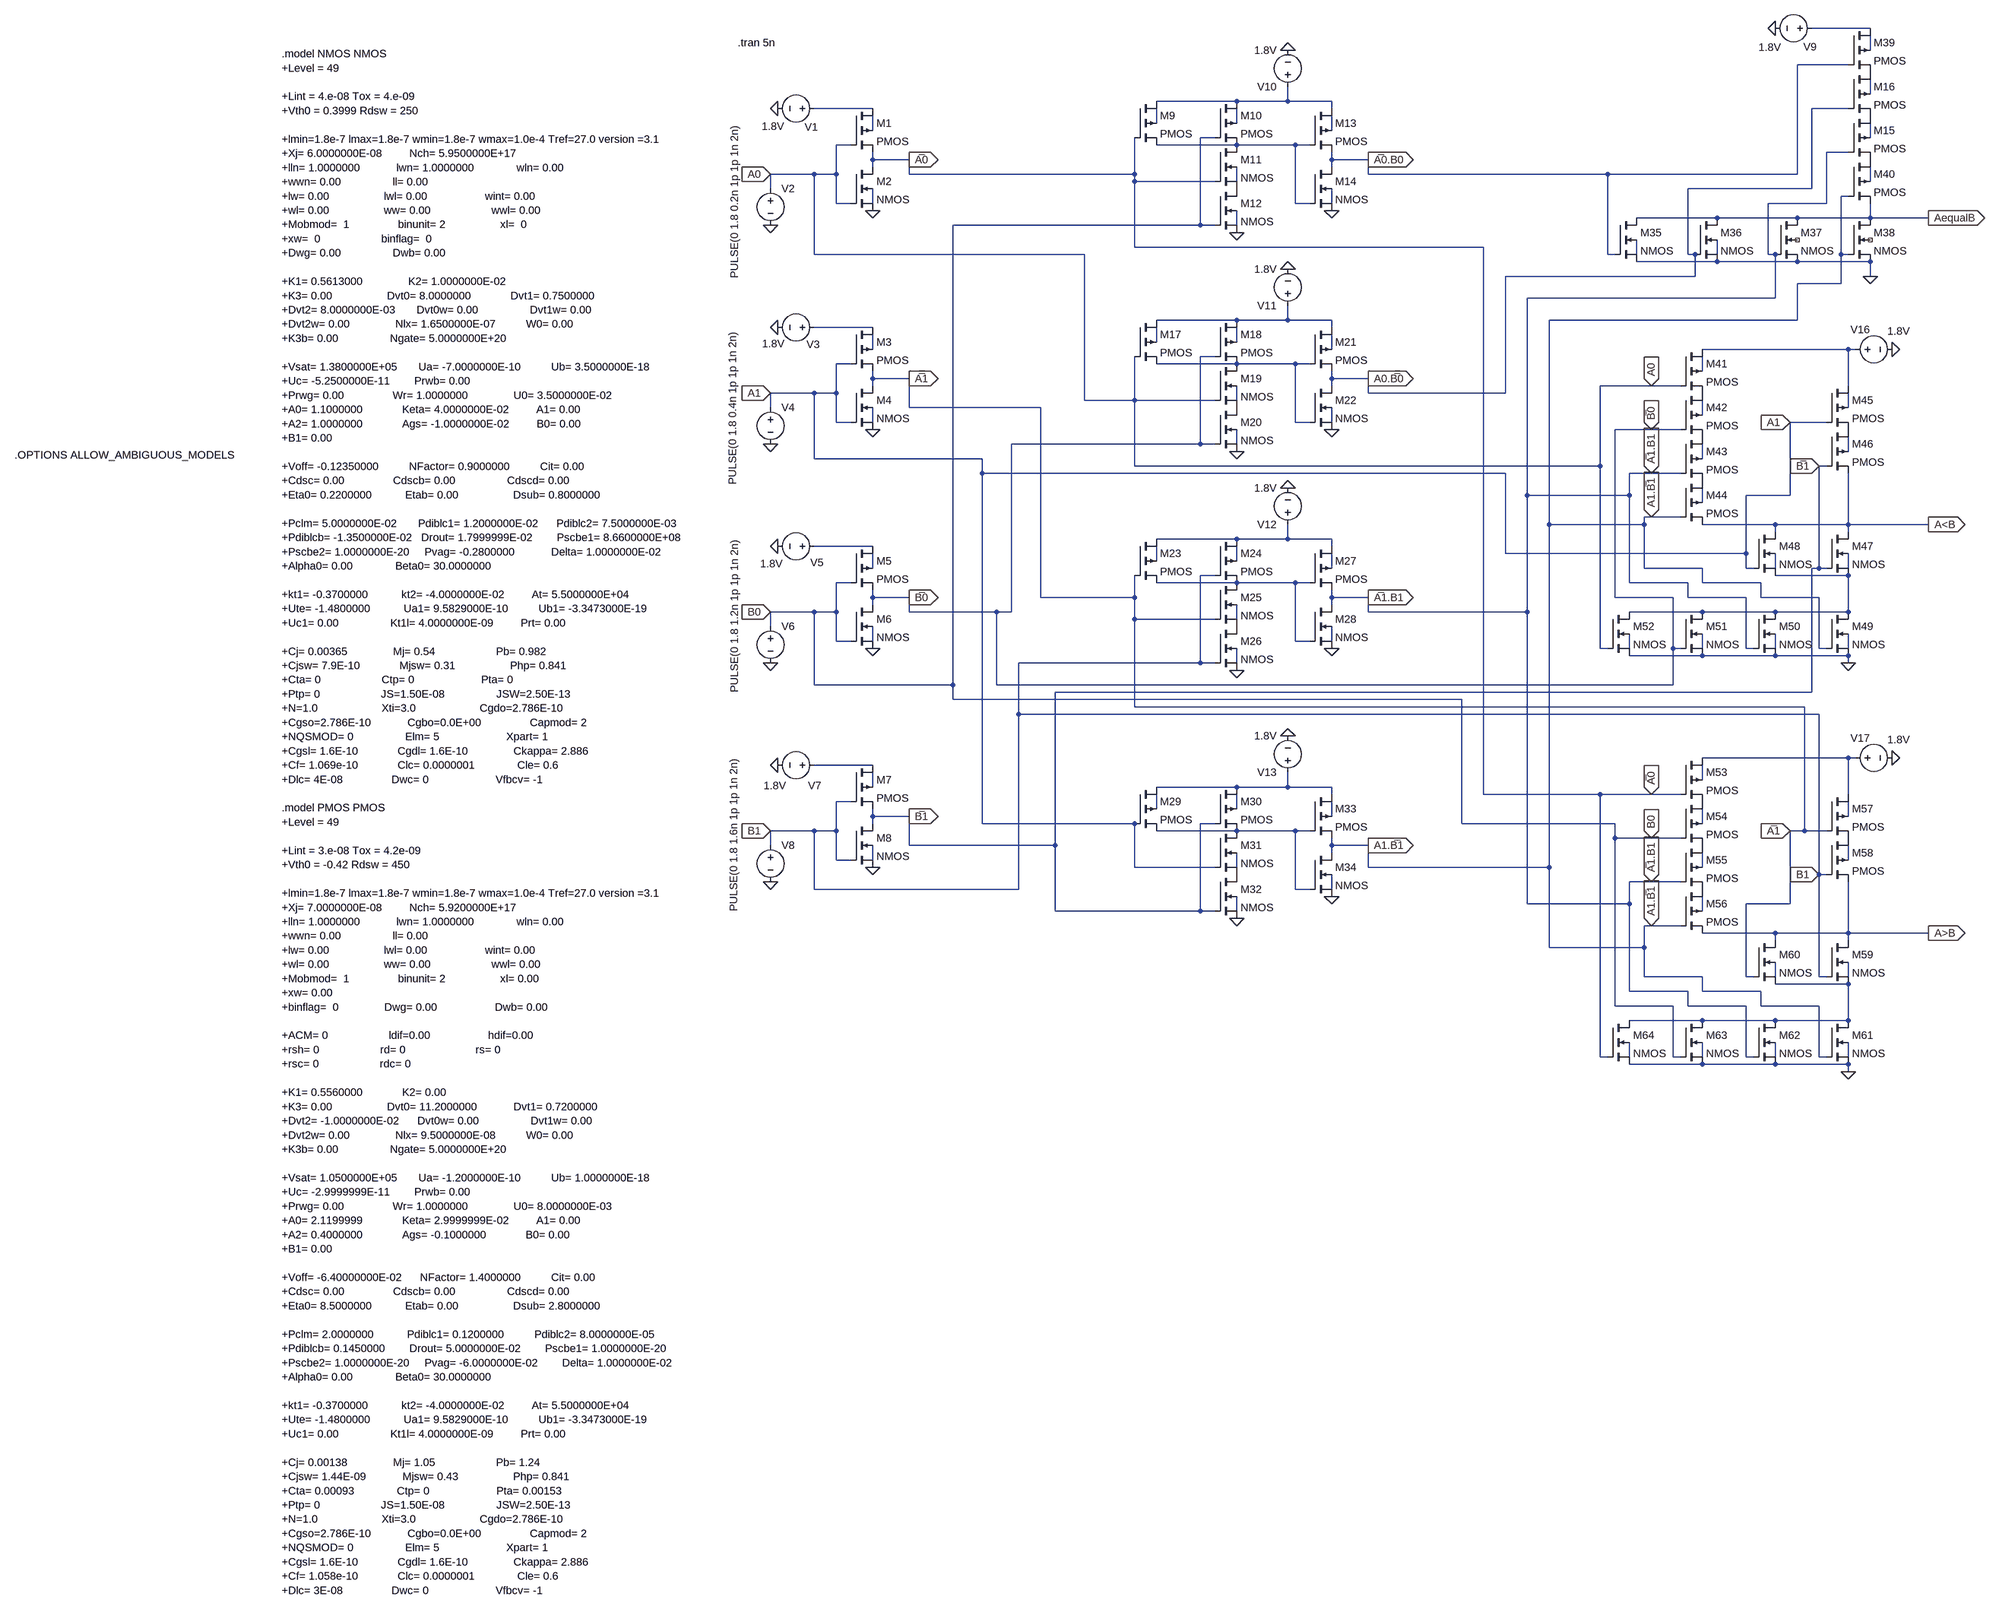
[diagram p0: schematic 2-bit-comparator.asc]
2-bit-comparator.asc, the LTspice schematic file:
Version 4.1
SHEET 1 2748 3000
WIRE 2464 -96 2336 -96
WIRE 2464 -48 2464 -80
WIRE 2416 -16 2304 -16
WIRE 2464 48 2464 16
WIRE 960 64 784 64
WIRE 1072 64 1072 32
WIRE 1072 64 960 64
WIRE 1168 64 1072 64
WIRE 160 80 32 80
WIRE 1168 80 1168 64
WIRE 2416 80 2336 80
WIRE 784 112 784 80
WIRE 960 112 960 80
WIRE 160 128 160 96
WIRE 1168 128 1168 96
WIRE 912 144 880 144
WIRE 2464 144 2464 112
WIRE 112 160 80 160
WIRE 960 160 784 160
WIRE 1088 160 960 160
WIRE 1120 160 1088 160
WIRE 2416 176 2368 176
WIRE 160 192 160 176
WIRE 240 192 160 192
WIRE 1168 192 1168 176
WIRE 1248 192 1168 192
WIRE 160 208 160 192
WIRE 1168 208 1168 192
WIRE 32 224 -64 224
WIRE 80 224 80 160
WIRE 80 224 32 224
WIRE 240 224 240 192
WIRE 736 224 736 144
WIRE 736 224 240 224
WIRE 1248 224 1248 192
WIRE 1888 224 1248 224
WIRE 2304 224 2304 -16
WIRE 2304 224 1888 224
WIRE 736 240 736 224
WIRE 912 240 736 240
WIRE 960 240 960 208
WIRE 2464 240 2464 208
WIRE -64 256 -64 224
WIRE 2336 256 2336 80
WIRE 2336 256 2064 256
WIRE 2416 272 2400 272
WIRE 80 288 80 224
WIRE 112 288 80 288
WIRE 160 288 160 256
WIRE 1088 288 1088 160
WIRE 1120 288 1088 288
WIRE 1168 288 1168 256
WIRE 2368 288 2368 176
WIRE 2368 288 2240 288
WIRE 2128 320 1952 320
WIRE 2304 320 2128 320
WIRE 2464 320 2464 288
WIRE 2464 320 2304 320
WIRE 2592 320 2464 320
WIRE 880 336 880 144
WIRE 880 336 336 336
WIRE 912 336 880 336
WIRE 960 336 960 304
WIRE 736 384 736 240
WIRE 1616 384 736 384
WIRE 32 400 32 224
WIRE 624 400 32 400
WIRE 1888 400 1888 224
WIRE 1904 400 1888 400
WIRE 1952 400 1952 368
WIRE 2064 400 2064 256
WIRE 2080 400 2064 400
WIRE 2128 400 2128 368
WIRE 2240 400 2240 288
WIRE 2256 400 2240 400
WIRE 2400 400 2400 272
WIRE 2416 400 2400 400
WIRE 2128 416 1952 416
WIRE 2304 416 2128 416
WIRE 2464 416 2304 416
WIRE 2080 448 2080 400
WIRE 2080 448 1664 448
WIRE 2464 448 2464 416
WIRE 2400 464 2400 400
WIRE 2400 464 2304 464
WIRE 2256 496 2256 400
WIRE 2256 496 1712 496
WIRE 960 544 784 544
WIRE 1072 544 1072 512
WIRE 1072 544 960 544
WIRE 1168 544 1072 544
WIRE 2304 544 2304 464
WIRE 2304 544 1760 544
WIRE 160 560 32 560
WIRE 1168 560 1168 544
WIRE 784 592 784 560
WIRE 960 592 960 560
WIRE 160 608 160 576
WIRE 1168 608 1168 576
WIRE 2416 608 2096 608
WIRE 2432 608 2416 608
WIRE 912 624 880 624
WIRE 112 640 80 640
WIRE 960 640 784 640
WIRE 1088 640 960 640
WIRE 1120 640 1088 640
WIRE 2096 656 2096 624
WIRE 160 672 160 656
WIRE 240 672 160 672
WIRE 1168 672 1168 656
WIRE 1248 672 1168 672
WIRE 160 688 160 672
WIRE 1168 688 1168 672
WIRE 1984 688 1872 688
WIRE 2048 688 1984 688
WIRE 2416 688 2416 608
WIRE 32 704 -64 704
WIRE 80 704 80 640
WIRE 80 704 32 704
WIRE 1248 704 1248 672
WIRE 1664 704 1664 448
WIRE 1664 704 1248 704
WIRE 624 720 624 400
WIRE 736 720 736 624
WIRE 736 720 624 720
WIRE 912 720 736 720
WIRE 960 720 960 688
WIRE -64 736 -64 704
WIRE 240 736 240 672
WIRE 528 736 240 736
WIRE 2416 736 2416 704
WIRE 2096 752 2096 720
WIRE 80 768 80 704
WIRE 112 768 80 768
WIRE 160 768 160 736
WIRE 1088 768 1088 640
WIRE 1120 768 1088 768
WIRE 1168 768 1168 736
WIRE 2368 768 2288 768
WIRE 1984 784 1904 784
WIRE 2048 784 1984 784
WIRE 880 816 880 624
WIRE 880 816 464 816
WIRE 912 816 880 816
WIRE 960 816 960 784
WIRE 2416 832 2416 800
WIRE 32 848 32 704
WIRE 400 848 32 848
WIRE 2096 848 2096 816
WIRE 736 864 736 720
WIRE 1872 864 1872 688
WIRE 1872 864 736 864
WIRE 2368 864 2352 864
WIRE 400 880 400 848
WIRE 1664 880 400 880
WIRE 1984 880 1936 880
WIRE 2048 880 1984 880
WIRE 1712 928 1712 496
WIRE 1936 928 1936 880
WIRE 1936 928 1712 928
WIRE 2288 928 2288 768
WIRE 2288 928 2192 928
WIRE 2096 944 2096 912
WIRE 1984 976 1968 976
WIRE 2048 976 1984 976
WIRE 1760 992 1760 544
WIRE 1968 992 1968 976
WIRE 1968 992 1760 992
WIRE 2256 992 2096 992
WIRE 2416 992 2416 880
WIRE 2416 992 2256 992
WIRE 2592 992 2416 992
WIRE 2256 1008 2256 992
WIRE 2416 1008 2416 992
WIRE 960 1024 784 1024
WIRE 1072 1024 1072 992
WIRE 1072 1024 960 1024
WIRE 1168 1024 1072 1024
WIRE 160 1040 32 1040
WIRE 1168 1040 1168 1024
WIRE 1664 1056 1664 880
WIRE 2192 1056 2192 928
WIRE 2192 1056 1664 1056
WIRE 784 1072 784 1040
WIRE 960 1072 960 1040
WIRE 160 1088 160 1056
WIRE 1168 1088 1168 1056
WIRE 1968 1088 1968 992
WIRE 2096 1088 1968 1088
WIRE 2192 1088 2192 1056
WIRE 2208 1088 2192 1088
WIRE 2256 1088 2256 1056
WIRE 2352 1088 2352 864
WIRE 2352 1088 2336 1088
WIRE 2368 1088 2352 1088
WIRE 2416 1088 2416 1056
WIRE 912 1104 880 1104
WIRE 2416 1104 2256 1104
WIRE 112 1120 80 1120
WIRE 960 1120 784 1120
WIRE 1088 1120 960 1120
WIRE 1120 1120 1088 1120
WIRE 1936 1120 1936 928
WIRE 2064 1120 1936 1120
WIRE 2096 1120 2096 1088
WIRE 2224 1120 2096 1120
WIRE 160 1152 160 1136
WIRE 240 1152 160 1152
WIRE 528 1152 528 736
WIRE 736 1152 736 1104
WIRE 736 1152 528 1152
WIRE 1168 1152 1168 1136
WIRE 1248 1152 1168 1152
WIRE 1904 1152 1904 784
WIRE 2032 1152 1904 1152
WIRE 2064 1152 2064 1120
WIRE 2192 1152 2064 1152
WIRE 2224 1152 2224 1120
WIRE 2352 1152 2224 1152
WIRE 160 1168 160 1152
WIRE 1168 1168 1168 1152
WIRE 32 1184 -64 1184
WIRE 80 1184 80 1120
WIRE 80 1184 32 1184
WIRE 240 1184 240 1152
WIRE 432 1184 240 1184
WIRE 464 1184 464 816
WIRE 464 1184 432 1184
WIRE 1248 1184 1248 1152
WIRE 1712 1184 1712 928
WIRE 1712 1184 1248 1184
WIRE 2096 1184 1936 1184
WIRE 2256 1184 2096 1184
WIRE 2416 1184 2416 1104
WIRE 2416 1184 2256 1184
WIRE 736 1200 736 1152
WIRE 912 1200 736 1200
WIRE 960 1200 960 1168
WIRE -64 1216 -64 1184
WIRE 80 1248 80 1184
WIRE 112 1248 80 1248
WIRE 160 1248 160 1216
WIRE 1088 1248 1088 1120
WIRE 1120 1248 1088 1248
WIRE 1168 1248 1168 1216
WIRE 1872 1264 1872 864
WIRE 1888 1264 1872 1264
WIRE 1936 1264 1936 1232
WIRE 2032 1264 2032 1152
WIRE 2048 1264 2032 1264
WIRE 2096 1264 2096 1232
WIRE 2192 1264 2192 1152
WIRE 2208 1264 2192 1264
WIRE 2256 1264 2256 1232
WIRE 2352 1264 2352 1152
WIRE 2368 1264 2352 1264
WIRE 2416 1264 2416 1232
WIRE 2096 1280 1936 1280
WIRE 2256 1280 2096 1280
WIRE 2416 1280 2256 1280
WIRE 880 1296 880 1104
WIRE 880 1296 480 1296
WIRE 912 1296 880 1296
WIRE 960 1296 960 1264
WIRE 2416 1296 2416 1280
WIRE 32 1344 32 1184
WIRE 336 1344 336 336
WIRE 336 1344 32 1344
WIRE 432 1344 432 1184
WIRE 2032 1344 2032 1264
WIRE 2032 1344 432 1344
WIRE 2336 1360 2336 1088
WIRE 2336 1360 560 1360
WIRE 336 1376 336 1344
WIRE 1568 1376 336 1376
WIRE 736 1392 736 1200
WIRE 2320 1392 736 1392
WIRE 480 1408 480 1296
WIRE 2352 1408 480 1408
WIRE 2416 1504 2096 1504
WIRE 2432 1504 2416 1504
WIRE 160 1520 32 1520
WIRE 2096 1552 2096 1520
WIRE 160 1568 160 1536
WIRE 960 1568 784 1568
WIRE 1072 1568 1072 1536
WIRE 1072 1568 960 1568
WIRE 1168 1568 1072 1568
WIRE 1168 1584 1168 1568
WIRE 1616 1584 1616 384
WIRE 1872 1584 1616 1584
WIRE 1984 1584 1872 1584
WIRE 2048 1584 1984 1584
WIRE 2416 1584 2416 1504
WIRE 112 1600 80 1600
WIRE 784 1616 784 1584
WIRE 960 1616 960 1584
WIRE 160 1632 160 1616
WIRE 240 1632 160 1632
WIRE 1168 1632 1168 1600
WIRE 2416 1632 2416 1600
WIRE 160 1648 160 1632
WIRE 400 1648 400 880
WIRE 736 1648 400 1648
WIRE 912 1648 880 1648
WIRE 1568 1648 1568 1376
WIRE 1904 1648 1568 1648
WIRE 2096 1648 2096 1616
WIRE 32 1664 -64 1664
WIRE 80 1664 80 1600
WIRE 80 1664 32 1664
WIRE 960 1664 784 1664
WIRE 1088 1664 960 1664
WIRE 1120 1664 1088 1664
WIRE 2320 1664 2320 1392
WIRE 2320 1664 2288 1664
WIRE 2368 1664 2320 1664
WIRE 1904 1680 1904 1648
WIRE 1984 1680 1904 1680
WIRE 2048 1680 1984 1680
WIRE -64 1696 -64 1664
WIRE 240 1696 240 1632
WIRE 560 1696 560 1360
WIRE 560 1696 240 1696
WIRE 1168 1696 1168 1680
WIRE 1248 1696 1168 1696
WIRE 1168 1712 1168 1696
WIRE 80 1728 80 1664
WIRE 112 1728 80 1728
WIRE 160 1728 160 1696
WIRE 2416 1728 2416 1696
WIRE 736 1744 736 1648
WIRE 912 1744 736 1744
WIRE 960 1744 960 1712
WIRE 1248 1744 1248 1696
WIRE 1760 1744 1760 992
WIRE 1760 1744 1248 1744
WIRE 2096 1744 2096 1712
WIRE 2352 1760 2352 1408
WIRE 2368 1760 2352 1760
WIRE 1984 1776 1936 1776
WIRE 2048 1776 1984 1776
WIRE 32 1792 32 1664
WIRE 480 1792 480 1408
WIRE 480 1792 32 1792
WIRE 1088 1792 1088 1664
WIRE 1120 1792 1088 1792
WIRE 1168 1792 1168 1760
WIRE 1712 1824 1712 1184
WIRE 1936 1824 1936 1776
WIRE 1936 1824 1712 1824
WIRE 2288 1824 2288 1664
WIRE 2288 1824 2192 1824
WIRE 560 1840 560 1696
WIRE 880 1840 880 1648
WIRE 880 1840 560 1840
WIRE 912 1840 880 1840
WIRE 960 1840 960 1808
WIRE 2096 1840 2096 1808
WIRE 1984 1872 1968 1872
WIRE 2048 1872 1984 1872
WIRE 2256 1888 2096 1888
WIRE 2416 1888 2416 1776
WIRE 2416 1888 2256 1888
WIRE 2592 1888 2416 1888
WIRE 2256 1904 2256 1888
WIRE 2416 1904 2416 1888
WIRE 1760 1920 1760 1744
WIRE 1968 1920 1968 1872
WIRE 1968 1920 1760 1920
WIRE 1968 1984 1968 1920
WIRE 2096 1984 1968 1984
WIRE 2192 1984 2192 1824
WIRE 2208 1984 2192 1984
WIRE 2256 1984 2256 1952
WIRE 2352 1984 2352 1760
WIRE 2368 1984 2352 1984
WIRE 2416 1984 2416 1952
WIRE 2416 2000 2256 2000
WIRE 1936 2016 1936 1824
WIRE 2064 2016 1936 2016
WIRE 2096 2016 2096 1984
WIRE 2224 2016 2096 2016
WIRE 1904 2048 1904 1680
WIRE 2032 2048 1904 2048
WIRE 2064 2048 2064 2016
WIRE 2192 2048 2064 2048
WIRE 2224 2048 2224 2016
WIRE 2352 2048 2224 2048
WIRE 2096 2080 1936 2080
WIRE 2256 2080 2096 2080
WIRE 2416 2080 2416 2000
WIRE 2416 2080 2256 2080
WIRE 1872 2160 1872 1584
WIRE 1888 2160 1872 2160
WIRE 1936 2160 1936 2128
WIRE 2032 2160 2032 2048
WIRE 2048 2160 2032 2160
WIRE 2096 2160 2096 2128
WIRE 2192 2160 2192 2048
WIRE 2208 2160 2192 2160
WIRE 2256 2160 2256 2128
WIRE 2352 2160 2352 2048
WIRE 2368 2160 2352 2160
WIRE 2416 2160 2416 2128
WIRE 2096 2176 1936 2176
WIRE 2256 2176 2096 2176
WIRE 2416 2176 2256 2176
WIRE 2416 2192 2416 2176
FLAG -48 80 0
FLAG -64 336 0
FLAG -64 224 A0
IOPIN -64 224 In
FLAG 160 304 0
FLAG 240 192 A̅0
IOPIN 240 192 Out
FLAG -48 560 0
FLAG -64 816 0
FLAG -64 704 A1
IOPIN -64 704 In
FLAG 160 784 0
FLAG 240 672 A̅1
IOPIN 240 672 Out
FLAG -48 1040 0
FLAG -64 1296 0
FLAG -64 1184 B0
IOPIN -64 1184 In
FLAG 160 1264 0
FLAG 240 1152 B̅0
IOPIN 240 1152 Out
FLAG -48 1520 0
FLAG -64 1776 0
FLAG -64 1664 B1
IOPIN -64 1664 In
FLAG 160 1744 0
FLAG 240 1632 B̅1
IOPIN 240 1632 Out
FLAG 960 352 0
FLAG 1168 304 0
FLAG 1248 192 A̅0.B0
IOPIN 1248 192 Out
FLAG 1072 -48 0
FLAG 960 832 0
FLAG 1168 784 0
FLAG 1248 672 A0.B̅0
IOPIN 1248 672 Out
FLAG 1072 432 0
FLAG 960 1312 0
FLAG 1168 1264 0
FLAG 1248 1152 A̅1.B1
IOPIN 1248 1152 Out
FLAG 1072 912 0
FLAG 960 1856 0
FLAG 1168 1808 0
FLAG 1248 1696 A1.B̅1
IOPIN 1248 1696 Out
FLAG 2592 320 AequalB
IOPIN 2592 320 Out
FLAG 2416 1296 0
FLAG 2592 992 A<B
IOPIN 2592 992 Out
FLAG 2512 608 0
FLAG 1984 688 A0
IOPIN 1984 688 In
FLAG 1984 784 B̅0
IOPIN 1984 784 In
FLAG 1984 880 A̅1.B1
IOPIN 1984 880 In
FLAG 1984 976 A1.B̅1
IOPIN 1984 976 In
FLAG 2288 768 A1
IOPIN 2288 768 In
FLAG 2352 864 B̅1
IOPIN 2352 864 In
FLAG 1072 1456 0
FLAG 2416 2192 0
FLAG 2592 1888 A>B
IOPIN 2592 1888 Out
FLAG 2512 1504 0
FLAG 1984 1584 A̅0
IOPIN 1984 1584 In
FLAG 1984 1680 B0
IOPIN 1984 1680 In
FLAG 1984 1776 A̅1.B1
IOPIN 1984 1776 In
FLAG 1984 1872 A1.B̅1
IOPIN 1984 1872 In
FLAG 2288 1664 A̅1
IOPIN 2288 1664 In
FLAG 2352 1760 B1
IOPIN 2352 1760 In
FLAG 2256 -96 0
FLAG 2464 448 0
SYMBOL pmos4 112 80 R0
SYMATTR InstName M1
SYMATTR Value2 l=180n w=400n
SYMBOL nmos4 112 208 R0
SYMATTR InstName M2
SYMATTR Value2 l=180n w=400n
SYMBOL voltage 48 80 R90
WINDOW 0 41 8 VRight 2
WINDOW 3 39 82 VRight 2
WINDOW 123 0 0 Left 0
WINDOW 39 0 0 Left 0
SYMATTR InstName V1
SYMATTR Value 1.8V
SYMBOL voltage -64 240 R0
WINDOW 3 -79 -125 VRight 2
WINDOW 123 0 0 Left 0
WINDOW 39 0 0 Left 0
SYMATTR Value PULSE(0 1.8 0.2n 1p 1p 1n 2n)
SYMATTR InstName V2
SYMBOL pmos4 112 560 R0
SYMATTR InstName M3
SYMATTR Value2 l=180n w=400n
SYMBOL nmos4 112 688 R0
SYMATTR InstName M4
SYMATTR Value2 l=180n w=400n
SYMBOL voltage 48 560 R90
WINDOW 0 37 4 VRight 2
WINDOW 3 36 81 VRight 2
WINDOW 123 0 0 Left 0
WINDOW 39 0 0 Left 0
SYMATTR InstName V3
SYMATTR Value 1.8V
SYMBOL voltage -64 720 R0
WINDOW 3 -83 -153 VRight 2
WINDOW 123 0 0 Left 0
WINDOW 39 0 0 Left 0
SYMATTR Value PULSE(0 1.8 0.4n 1p 1p 1n 2n)
SYMATTR InstName V4
SYMBOL pmos4 112 1040 R0
SYMATTR InstName M5
SYMATTR Value2 l=180n w=400n
SYMBOL nmos4 112 1168 R0
SYMATTR InstName M6
SYMATTR Value2 l=180n w=400n
SYMBOL voltage 48 1040 R90
WINDOW 0 36 -5 VRight 2
WINDOW 3 38 85 VRight 2
WINDOW 123 0 0 Left 0
WINDOW 39 0 0 Left 0
SYMATTR InstName V5
SYMATTR Value 1.8V
SYMBOL voltage -64 1200 R0
WINDOW 3 -79 -177 VRight 2
WINDOW 123 0 0 Left 0
WINDOW 39 0 0 Left 0
SYMATTR Value PULSE(0 1.8 1.2n 1p 1p 1n 2n)
SYMATTR InstName V6
SYMBOL pmos4 112 1520 R0
SYMATTR InstName M7
SYMATTR Value2 l=180n w=400n
SYMBOL nmos4 112 1648 R0
SYMATTR InstName M8
SYMATTR Value2 l=180n w=400n
SYMBOL voltage 48 1520 R90
WINDOW 0 45 0 VRight 2
WINDOW 3 45 78 VRight 2
WINDOW 123 0 0 Left 0
WINDOW 39 0 0 Left 0
SYMATTR InstName V7
SYMATTR Value 1.8V
SYMBOL voltage -64 1680 R0
WINDOW 3 -80 -177 VRight 2
WINDOW 123 0 0 Left 0
WINDOW 39 0 0 Left 0
SYMATTR Value PULSE(0 1.8 1.6n 1p 1p 1n 2n)
SYMATTR InstName V8
SYMBOL pmos4 736 64 R0
SYMATTR InstName M9
SYMATTR Value2 l=180n w=400n
SYMBOL pmos4 912 64 R0
SYMATTR InstName M10
SYMATTR Value2 l=180n w=400n
SYMBOL nmos4 912 160 R0
SYMATTR InstName M11
SYMATTR Value2 l=180n w=400n
SYMBOL nmos4 912 256 R0
SYMATTR InstName M12
SYMATTR Value2 l=180n w=400n
SYMBOL pmos4 1120 80 R0
SYMATTR InstName M13
SYMATTR Value2 l=180n w=400n
SYMBOL nmos4 1120 208 R0
SYMATTR InstName M14
SYMATTR Value2 l=180n w=400n
SYMBOL voltage 1072 48 R180
WINDOW 123 0 0 Left 0
WINDOW 39 0 0 Left 0
SYMATTR InstName V10
SYMATTR Value 1.8V
SYMBOL pmos4 736 544 R0
SYMATTR InstName M17
SYMATTR Value2 l=180n w=400n
SYMBOL pmos4 912 544 R0
SYMATTR InstName M18
SYMATTR Value2 l=180n w=400n
SYMBOL nmos4 912 640 R0
SYMATTR InstName M19
SYMATTR Value2 l=180n w=400n
SYMBOL nmos4 912 736 R0
SYMATTR InstName M20
SYMATTR Value2 l=180n w=400n
SYMBOL pmos4 1120 560 R0
SYMATTR InstName M21
SYMATTR Value2 l=180n w=400n
SYMBOL nmos4 1120 688 R0
SYMATTR InstName M22
SYMATTR Value2 l=180n w=400n
SYMBOL voltage 1072 528 R180
WINDOW 123 0 0 Left 0
WINDOW 39 0 0 Left 0
SYMATTR InstName V11
SYMATTR Value 1.8V
SYMBOL pmos4 736 1024 R0
SYMATTR InstName M23
SYMATTR Value2 l=180n w=400n
SYMBOL pmos4 912 1024 R0
SYMATTR InstName M24
SYMATTR Value2 l=180n w=400n
SYMBOL nmos4 912 1120 R0
SYMATTR InstName M25
SYMATTR Value2 l=180n w=400n
SYMBOL nmos4 912 1216 R0
SYMATTR InstName M26
SYMATTR Value2 l=180n w=400n
SYMBOL pmos4 1120 1040 R0
SYMATTR InstName M27
SYMATTR Value2 l=180n w=400n
SYMBOL nmos4 1120 1168 R0
SYMATTR InstName M28
SYMATTR Value2 l=180n w=400n
SYMBOL voltage 1072 1008 R180
WINDOW 123 0 0 Left 0
WINDOW 39 0 0 Left 0
SYMATTR InstName V12
SYMATTR Value 1.8V
SYMBOL pmos4 736 1568 R0
SYMATTR InstName M29
SYMATTR Value2 l=180n w=400n
SYMBOL pmos4 912 1568 R0
SYMATTR InstName M30
SYMATTR Value2 l=180n w=400n
SYMBOL nmos4 912 1664 R0
SYMATTR InstName M31
SYMATTR Value2 l=180n w=400n
SYMBOL nmos4 912 1760 R0
SYMATTR InstName M32
SYMATTR Value2 l=180n w=400n
SYMBOL pmos4 1120 1584 R0
SYMATTR InstName M33
SYMATTR Value2 l=180n w=400n
SYMBOL nmos4 1120 1712 R0
SYMATTR InstName M34
SYMATTR Value2 l=180n w=400n
SYMBOL voltage 1072 1552 R180
WINDOW 123 0 0 Left 0
WINDOW 39 0 0 Left 0
SYMATTR InstName V13
SYMATTR Value 1.8V
SYMBOL nmos4 1904 320 R0
SYMATTR InstName M35
SYMATTR Value2 l=180n w=400n
SYMBOL nmos4 2080 320 R0
SYMATTR InstName M36
SYMATTR Value2 l=180n w=400n
SYMBOL nmos4 2256 320 R0
SYMATTR InstName M37
SYMATTR Value2 l=180n w=400n
SYMBOL nmos4 2416 320 R0
SYMATTR InstName M38
SYMATTR Value2 l=180n w=400n
SYMBOL pmos4 2416 192 R0
SYMATTR InstName M40
SYMATTR Value2 l=180n w=400n
SYMBOL pmos4 2048 608 R0
SYMATTR InstName M41
SYMATTR Value2 l=180n w=400n
SYMBOL pmos4 2048 704 R0
SYMATTR InstName M42
SYMATTR Value2 l=180n w=400n
SYMBOL pmos4 2048 800 R0
SYMATTR InstName M43
SYMATTR Value2 l=180n w=400n
SYMBOL pmos4 2048 896 R0
SYMATTR InstName M44
SYMATTR Value2 l=180n w=400n
SYMBOL pmos4 2368 688 R0
SYMATTR InstName M45
SYMATTR Value2 l=180n w=400n
SYMBOL pmos4 2368 784 R0
SYMATTR InstName M46
SYMATTR Value2 l=180n w=400n
SYMBOL nmos4 2368 1008 R0
SYMATTR InstName M47
SYMATTR Value2 l=180n w=400n
SYMBOL nmos4 2208 1008 R0
SYMATTR InstName M48
SYMATTR Value2 l=180n w=400n
SYMBOL nmos4 2368 1184 R0
SYMATTR InstName M49
SYMATTR Value2 l=180n w=400n
SYMBOL nmos4 2208 1184 R0
SYMATTR InstName M50
SYMATTR Value2 l=180n w=400n
SYMBOL nmos4 2048 1184 R0
SYMATTR InstName M51
SYMATTR Value2 l=180n w=400n
SYMBOL nmos4 1888 1184 R0
SYMATTR InstName M52
SYMATTR Value2 l=180n w=400n
SYMBOL voltage 2416 608 R270
WINDOW 0 43 5 VRight 2
WINDOW 3 40 86 VRight 2
WINDOW 123 0 0 Left 0
WINDOW 39 0 0 Left 0
SYMATTR InstName V16
SYMATTR Value 1.8V
SYMBOL pmos4 2048 1504 R0
SYMATTR InstName M53
SYMATTR Value2 l=180n w=400n
SYMBOL pmos4 2048 1600 R0
SYMATTR InstName M54
SYMATTR Value2 l=180n w=400n
SYMBOL pmos4 2048 1696 R0
SYMATTR InstName M55
SYMATTR Value2 l=180n w=400n
SYMBOL pmos4 2048 1792 R0
SYMATTR InstName M56
SYMATTR Value2 l=180n w=400n
SYMBOL pmos4 2368 1584 R0
SYMATTR InstName M57
SYMATTR Value2 l=180n w=400n
SYMBOL pmos4 2368 1680 R0
SYMATTR InstName M58
SYMATTR Value2 l=180n w=400n
SYMBOL nmos4 2368 1904 R0
SYMATTR InstName M59
SYMATTR Value2 l=180n w=400n
SYMBOL nmos4 2208 1904 R0
SYMATTR InstName M60
SYMATTR Value2 l=180n w=400n
SYMBOL nmos4 2368 2080 R0
SYMATTR InstName M61
SYMATTR Value2 l=180n w=400n
SYMBOL nmos4 2208 2080 R0
SYMATTR InstName M62
SYMATTR Value2 l=180n w=400n
SYMBOL nmos4 2048 2080 R0
SYMATTR InstName M63
SYMATTR Value2 l=180n w=400n
SYMBOL nmos4 1888 2080 R0
SYMATTR InstName M64
SYMATTR Value2 l=180n w=400n
SYMBOL voltage 2416 1504 R270
WINDOW 0 43 5 VRight 2
WINDOW 3 40 86 VRight 2
WINDOW 123 0 0 Left 0
WINDOW 39 0 0 Left 0
SYMATTR InstName V17
SYMATTR Value 1.8V
SYMBOL pmos4 2416 96 R0
SYMATTR InstName M15
SYMATTR Value2 l=180n w=400n
SYMBOL pmos4 2416 0 R0
SYMATTR InstName M16
SYMATTR Value2 l=180n w=400n
SYMBOL pmos4 2416 -96 R0
SYMATTR InstName M39
SYMATTR Value2 l=180n w=400n
SYMBOL voltage 2352 -96 R90
WINDOW 123 0 0 Left 0
WINDOW 39 0 0 Left 0
WINDOW 0 41 5 VRight 2
WINDOW 3 42 83 VRight 2
SYMATTR InstName V9
SYMATTR Value 1.8V
TEXT -1256 -40 Left 2 !.model NMOS NMOS\n+Level = 49\n \n+Lint = 4.e-08 Tox = 4.e-09 \n+Vth0 = 0.3999 Rdsw = 250 \n \n+lmin=1.8e-7 lmax=1.8e-7 wmin=1.8e-7 wmax=1.0e-4 Tref=27.0 version =3.1\n+Xj= 6.0000000E-08         Nch= 5.9500000E+17 \n+lln= 1.0000000            lwn= 1.0000000              wln= 0.00\n+wwn= 0.00                 ll= 0.00\n+lw= 0.00                  lwl= 0.00                   wint= 0.00\n+wl= 0.00                  ww= 0.00                    wwl= 0.00\n+Mobmod=  1                binunit= 2                  xl=  0\n+xw=  0                    binflag=  0\n+Dwg= 0.00                 Dwb= 0.00 \n \n+K1= 0.5613000               K2= 1.0000000E-02 \n+K3= 0.00                  Dvt0= 8.0000000             Dvt1= 0.7500000 \n+Dvt2= 8.0000000E-03       Dvt0w= 0.00                 Dvt1w= 0.00 \n+Dvt2w= 0.00               Nlx= 1.6500000E-07          W0= 0.00 \n+K3b= 0.00                 Ngate= 5.0000000E+20 \n \n+Vsat= 1.3800000E+05       Ua= -7.0000000E-10          Ub= 3.5000000E-18 \n+Uc= -5.2500000E-11        Prwb= 0.00 \n+Prwg= 0.00                Wr= 1.0000000               U0= 3.5000000E-02 \n+A0= 1.1000000             Keta= 4.0000000E-02         A1= 0.00 \n+A2= 1.0000000             Ags= -1.0000000E-02         B0= 0.00 \n+B1= 0.00 \n \n+Voff= -0.12350000          NFactor= 0.9000000          Cit= 0.00 \n+Cdsc= 0.00                Cdscb= 0.00                 Cdscd= 0.00 \n+Eta0= 0.2200000           Etab= 0.00                  Dsub= 0.8000000 \n \n+Pclm= 5.0000000E-02       Pdiblc1= 1.2000000E-02      Pdiblc2= 7.5000000E-03 \n+Pdiblcb= -1.3500000E-02   Drout= 1.7999999E-02        Pscbe1= 8.6600000E+08 \n+Pscbe2= 1.0000000E-20     Pvag= -0.2800000            Delta= 1.0000000E-02 \n+Alpha0= 0.00              Beta0= 30.0000000 \n \n+kt1= -0.3700000           kt2= -4.0000000E-02         At= 5.5000000E+04 \n+Ute= -1.4800000           Ua1= 9.5829000E-10          Ub1= -3.3473000E-19 \n+Uc1= 0.00                 Kt1l= 4.0000000E-09         Prt= 0.00 \n \n+Cj= 0.00365               Mj= 0.54                    Pb= 0.982\n+Cjsw= 7.9E-10             Mjsw= 0.31                  Php= 0.841\n+Cta= 0                    Ctp= 0                      Pta= 0\n+Ptp= 0                    JS=1.50E-08                 JSW=2.50E-13\n+N=1.0                     Xti=3.0                     Cgdo=2.786E-10\n+Cgso=2.786E-10            Cgbo=0.0E+00                Capmod= 2\n+NQSMOD= 0                 Elm= 5                      Xpart= 1\n+Cgsl= 1.6E-10             Cgdl= 1.6E-10               Ckappa= 2.886\n+Cf= 1.069e-10             Clc= 0.0000001              Cle= 0.6\n+Dlc= 4E-08                Dwc= 0                      Vfbcv= -1\n \n.model PMOS PMOS\n+Level = 49\n \n+Lint = 3.e-08 Tox = 4.2e-09 \n+Vth0 = -0.42 Rdsw = 450 \n \n+lmin=1.8e-7 lmax=1.8e-7 wmin=1.8e-7 wmax=1.0e-4 Tref=27.0 version =3.1\n+Xj= 7.0000000E-08         Nch= 5.9200000E+17 \n+lln= 1.0000000            lwn= 1.0000000              wln= 0.00\n+wwn= 0.00                 ll= 0.00\n+lw= 0.00                  lwl= 0.00                   wint= 0.00\n+wl= 0.00                  ww= 0.00                    wwl= 0.00\n+Mobmod=  1                binunit= 2                  xl= 0.00\n+xw= 0.00                  \n+binflag=  0               Dwg= 0.00                   Dwb= 0.00 \n \n+ACM= 0                    ldif=0.00                   hdif=0.00\n+rsh= 0                    rd= 0                       rs= 0\n+rsc= 0                    rdc= 0\n \n+K1= 0.5560000             K2= 0.00 \n+K3= 0.00                  Dvt0= 11.2000000            Dvt1= 0.7200000 \n+Dvt2= -1.0000000E-02      Dvt0w= 0.00                 Dvt1w= 0.00 \n+Dvt2w= 0.00               Nlx= 9.5000000E-08          W0= 0.00 \n+K3b= 0.00                 Ngate= 5.0000000E+20 \n \n+Vsat= 1.0500000E+05       Ua= -1.2000000E-10          Ub= 1.0000000E-18 \n+Uc= -2.9999999E-11        Prwb= 0.00 \n+Prwg= 0.00                Wr= 1.0000000               U0= 8.0000000E-03 \n+A0= 2.1199999             Keta= 2.9999999E-02         A1= 0.00 \n+A2= 0.4000000             Ags= -0.1000000             B0= 0.00 \n+B1= 0.00 \n \n+Voff= -6.40000000E-02      NFactor= 1.4000000          Cit= 0.00 \n+Cdsc= 0.00                Cdscb= 0.00                 Cdscd= 0.00 \n+Eta0= 8.5000000           Etab= 0.00                  Dsub= 2.8000000 \n \n+Pclm= 2.0000000           Pdiblc1= 0.1200000          Pdiblc2= 8.0000000E-05 \n+Pdiblcb= 0.1450000        Drout= 5.0000000E-02        Pscbe1= 1.0000000E-20 \n+Pscbe2= 1.0000000E-20     Pvag= -6.0000000E-02        Delta= 1.0000000E-02 \n+Alpha0= 0.00              Beta0= 30.0000000 \n \n+kt1= -0.3700000           kt2= -4.0000000E-02         At= 5.5000000E+04 \n+Ute= -1.4800000           Ua1= 9.5829000E-10          Ub1= -3.3473000E-19 \n+Uc1= 0.00                 Kt1l= 4.0000000E-09         Prt= 0.00 \n \n+Cj= 0.00138               Mj= 1.05                    Pb= 1.24\n+Cjsw= 1.44E-09            Mjsw= 0.43                  Php= 0.841\n+Cta= 0.00093              Ctp= 0                      Pta= 0.00153\n+Ptp= 0                    JS=1.50E-08                 JSW=2.50E-13\n+N=1.0                     Xti=3.0                     Cgdo=2.786E-10\n+Cgso=2.786E-10            Cgbo=0.0E+00                Capmod= 2\n+NQSMOD= 0                 Elm= 5                      Xpart= 1\n+Cgsl= 1.6E-10             Cgdl= 1.6E-10               Ckappa= 2.886\n+Cf= 1.058e-10             Clc= 0.0000001              Cle= 0.6\n+Dlc= 3E-08                Dwc= 0                      Vfbcv= -1
TEXT -136 -64 Left 2 !.tran 5n
TEXT -1960 840 Left 2 !.OPTIONS ALLOW_AMBIGUOUS_MODELS

The netlist it stands for:
* 2-bit-comparator.asc
M1 N005 A0 A̅0 N008 PMOS l=180n w=400n
M2 A̅0 A0 0 N014 NMOS l=180n w=400n
V1 N005 0 1.8V
V2 A0 0 PULSE(0 1.8 0.2n 1p 1p 1n 2n)
M3 N020 A1 A̅1 N023 PMOS l=180n w=400n
M4 A̅1 A1 0 N031 NMOS l=180n w=400n
V3 N020 0 1.8V
V4 A1 0 PULSE(0 1.8 0.4n 1p 1p 1n 2n)
M5 N038 B0 B̅0 N041 PMOS l=180n w=400n
M6 B̅0 B0 0 N048 NMOS l=180n w=400n
V5 N038 0 1.8V
V6 B0 0 PULSE(0 1.8 1.2n 1p 1p 1n 2n)
M7 N056 B1 B̅1 N058 PMOS l=180n w=400n
M8 B̅1 B1 0 N066 NMOS l=180n w=400n
V7 N056 0 1.8V
V8 B1 0 PULSE(0 1.8 1.6n 1p 1p 1n 2n)
M9 N004 A̅0 N011 N006 PMOS l=180n w=400n
M10 N004 B0 N011 N007 PMOS l=180n w=400n
M11 N011 A̅0 P001 N012 NMOS l=180n w=400n
M12 P001 B0 0 N016 NMOS l=180n w=400n
M13 N004 N011 A̅0.B0 N009 PMOS l=180n w=400n
M14 A̅0.B0 N011 0 N015 NMOS l=180n w=400n
V10 N004 0 1.8V
M17 N019 A0 N026 N021 PMOS l=180n w=400n
M18 N019 B̅0 N026 N022 PMOS l=180n w=400n
M19 N026 A0 P002 N028 NMOS l=180n w=400n
M20 P002 B̅0 0 N033 NMOS l=180n w=400n
M21 N019 N026 A0.B̅0 N024 PMOS l=180n w=400n
M22 A0.B̅0 N026 0 N032 NMOS l=180n w=400n
V11 N019 0 1.8V
M23 N037 A̅1 N046 N039 PMOS l=180n w=400n
M24 N037 B1 N046 N040 PMOS l=180n w=400n
M25 N046 A̅1 P003 N047 NMOS l=180n w=400n
M26 P003 B1 0 N054 NMOS l=180n w=400n
M27 N037 N046 A̅1.B1 N042 PMOS l=180n w=400n
M28 A̅1.B1 N046 0 N049 NMOS l=180n w=400n
V12 N037 0 1.8V
M29 N059 A1 N065 N060 PMOS l=180n w=400n
M30 N059 B̅1 N065 N061 PMOS l=180n w=400n
M31 N065 A1 P004 N068 NMOS l=180n w=400n
M32 P004 B̅1 0 N071 NMOS l=180n w=400n
M33 N059 N065 A1.B̅1 N062 PMOS l=180n w=400n
M34 A1.B̅1 N065 0 N070 NMOS l=180n w=400n
V13 N059 0 1.8V
M35 AequalB A̅0.B0 0 N017 NMOS l=180n w=400n
M36 AequalB A0.B̅0 0 N018 NMOS l=180n w=400n
M37 AequalB A̅1.B1 0 NC_01 NMOS l=180n w=400n
M38 AequalB A1.B̅1 0 NC_02 NMOS l=180n w=400n
M40 P005 A1.B̅1 AequalB N013 PMOS l=180n w=400n
M41 N025 A0 P006 N027 PMOS l=180n w=400n
M42 P006 B̅0 P007 N030 PMOS l=180n w=400n
M43 P007 A̅1.B1 P008 N035 PMOS l=180n w=400n
M44 P008 A1.B̅1 A<B N036 PMOS l=180n w=400n
M45 N025 A1 P009 N029 PMOS l=180n w=400n
M46 P009 B̅1 A<B N034 PMOS l=180n w=400n
M47 A<B B̅1 N045 N044 NMOS l=180n w=400n
M48 A<B A1 N045 N043 NMOS l=180n w=400n
M49 N045 A1.B̅1 0 N053 NMOS l=180n w=400n
M50 N045 A̅1.B1 0 N052 NMOS l=180n w=400n
M51 N045 B̅0 0 N051 NMOS l=180n w=400n
M52 N045 A0 0 N050 NMOS l=180n w=400n
V16 N025 0 1.8V
M53 N055 A̅0 P010 N057 PMOS l=180n w=400n
M54 P010 B0 P011 N064 PMOS l=180n w=400n
M55 P011 A̅1.B1 P012 N069 PMOS l=180n w=400n
M56 P012 A1.B̅1 A>B N072 PMOS l=180n w=400n
M57 N055 A̅1 P013 N063 PMOS l=180n w=400n
M58 P013 B1 A>B N067 PMOS l=180n w=400n
M59 A>B B1 N075 N074 NMOS l=180n w=400n
M60 A>B A̅1 N075 N073 NMOS l=180n w=400n
M61 N075 A1.B̅1 0 N079 NMOS l=180n w=400n
M62 N075 A̅1.B1 0 N078 NMOS l=180n w=400n
M63 N075 B0 0 N077 NMOS l=180n w=400n
M64 N075 A̅0 0 N076 NMOS l=180n w=400n
V17 N055 0 1.8V
M15 P014 A̅1.B1 P005 N010 PMOS l=180n w=400n
M16 P015 A0.B̅0 P014 N003 PMOS l=180n w=400n
M39 N001 A̅0.B0 P015 N002 PMOS l=180n w=400n
V9 N001 0 1.8V
.model NMOS NMOS
.model PMOS PMOS
.lib standard.mos
.model NMOS NMOS
+Level = 49
+Lint = 4.e-08 Tox = 4.e-09
+Vth0 = 0.3999 Rdsw = 250
+lmin=1.8e-7 lmax=1.8e-7 wmin=1.8e-7 wmax=1.0e-4 Tref=27.0 version =3.1
+Xj= 6.0000000E-08         Nch= 5.9500000E+17
+lln= 1.0000000            lwn= 1.0000000              wln= 0.00
+wwn= 0.00                 ll= 0.00
+lw= 0.00                  lwl= 0.00                   wint= 0.00
+wl= 0.00                  ww= 0.00                    wwl= 0.00
+Mobmod=  1                binunit= 2                  xl=  0
+xw=  0                    binflag=  0
+Dwg= 0.00                 Dwb= 0.00
+K1= 0.5613000               K2= 1.0000000E-02
+K3= 0.00                  Dvt0= 8.0000000             Dvt1= 0.7500000
+Dvt2= 8.0000000E-03       Dvt0w= 0.00                 Dvt1w= 0.00
+Dvt2w= 0.00               Nlx= 1.6500000E-07          W0= 0.00
+K3b= 0.00                 Ngate= 5.0000000E+20
+Vsat= 1.3800000E+05       Ua= -7.0000000E-10          Ub= 3.5000000E-18
+Uc= -5.2500000E-11        Prwb= 0.00
+Prwg= 0.00                Wr= 1.0000000               U0= 3.5000000E-02
+A0= 1.1000000             Keta= 4.0000000E-02         A1= 0.00
+A2= 1.0000000             Ags= -1.0000000E-02         B0= 0.00
+B1= 0.00
+Voff= -0.12350000          NFactor= 0.9000000          Cit= 0.00
+Cdsc= 0.00                Cdscb= 0.00                 Cdscd= 0.00
+Eta0= 0.2200000           Etab= 0.00                  Dsub= 0.8000000
+Pclm= 5.0000000E-02       Pdiblc1= 1.2000000E-02      Pdiblc2= 7.5000000E-03
+Pdiblcb= -1.3500000E-02   Drout= 1.7999999E-02        Pscbe1= 8.6600000E+08
+Pscbe2= 1.0000000E-20     Pvag= -0.2800000            Delta= 1.0000000E-02
+Alpha0= 0.00              Beta0= 30.0000000
+kt1= -0.3700000           kt2= -4.0000000E-02         At= 5.5000000E+04
+Ute= -1.4800000           Ua1= 9.5829000E-10          Ub1= -3.3473000E-19
+Uc1= 0.00                 Kt1l= 4.0000000E-09         Prt= 0.00
+Cj= 0.00365               Mj= 0.54                    Pb= 0.982
+Cjsw= 7.9E-10             Mjsw= 0.31                  Php= 0.841
+Cta= 0                    Ctp= 0                      Pta= 0
+Ptp= 0                    JS=1.50E-08                 JSW=2.50E-13
+N=1.0                     Xti=3.0                     Cgdo=2.786E-10
+Cgso=2.786E-10            Cgbo=0.0E+00                Capmod= 2
+NQSMOD= 0                 Elm= 5                      Xpart= 1
+Cgsl= 1.6E-10             Cgdl= 1.6E-10               Ckappa= 2.886
+Cf= 1.069e-10             Clc= 0.0000001              Cle= 0.6
+Dlc= 4E-08                Dwc= 0                      Vfbcv= -1
.model PMOS PMOS
+Level = 49
+Lint = 3.e-08 Tox = 4.2e-09
+Vth0 = -0.42 Rdsw = 450
+lmin=1.8e-7 lmax=1.8e-7 wmin=1.8e-7 wmax=1.0e-4 Tref=27.0 version =3.1
+Xj= 7.0000000E-08         Nch= 5.9200000E+17
+lln= 1.0000000            lwn= 1.0000000              wln= 0.00
+wwn= 0.00                 ll= 0.00
+lw= 0.00                  lwl= 0.00                   wint= 0.00
+wl= 0.00                  ww= 0.00                    wwl= 0.00
+Mobmod=  1                binunit= 2                  xl= 0.00
+xw= 0.00
+binflag=  0               Dwg= 0.00                   Dwb= 0.00
+ACM= 0                    ldif=0.00                   hdif=0.00
+rsh= 0                    rd= 0                       rs= 0
+rsc= 0                    rdc= 0
+K1= 0.5560000             K2= 0.00
+K3= 0.00                  Dvt0= 11.2000000            Dvt1= 0.7200000
+Dvt2= -1.0000000E-02      Dvt0w= 0.00                 Dvt1w= 0.00
+Dvt2w= 0.00               Nlx= 9.5000000E-08          W0= 0.00
+K3b= 0.00                 Ngate= 5.0000000E+20
+Vsat= 1.0500000E+05       Ua= -1.2000000E-10          Ub= 1.0000000E-18
+Uc= -2.9999999E-11        Prwb= 0.00
+Prwg= 0.00                Wr= 1.0000000               U0= 8.0000000E-03
+A0= 2.1199999             Keta= 2.9999999E-02         A1= 0.00
+A2= 0.4000000             Ags= -0.1000000             B0= 0.00
+B1= 0.00
+Voff= -6.40000000E-02      NFactor= 1.4000000          Cit= 0.00
+Cdsc= 0.00                Cdscb= 0.00                 Cdscd= 0.00
+Eta0= 8.5000000           Etab= 0.00                  Dsub= 2.8000000
+Pclm= 2.0000000           Pdiblc1= 0.1200000          Pdiblc2= 8.0000000E-05
+Pdiblcb= 0.1450000        Drout= 5.0000000E-02        Pscbe1= 1.0000000E-20
+Pscbe2= 1.0000000E-20     Pvag= -6.0000000E-02        Delta= 1.0000000E-02
+Alpha0= 0.00              Beta0= 30.0000000
+kt1= -0.3700000           kt2= -4.0000000E-02         At= 5.5000000E+04
+Ute= -1.4800000           Ua1= 9.5829000E-10          Ub1= -3.3473000E-19
+Uc1= 0.00                 Kt1l= 4.0000000E-09         Prt= 0.00
+Cj= 0.00138               Mj= 1.05                    Pb= 1.24
+Cjsw= 1.44E-09            Mjsw= 0.43                  Php= 0.841
+Cta= 0.00093              Ctp= 0                      Pta= 0.00153
+Ptp= 0                    JS=1.50E-08                 JSW=2.50E-13
+N=1.0                     Xti=3.0                     Cgdo=2.786E-10
+Cgso=2.786E-10            Cgbo=0.0E+00                Capmod= 2
+NQSMOD= 0                 Elm= 5                      Xpart= 1
+Cgsl= 1.6E-10             Cgdl= 1.6E-10               Ckappa= 2.886
+Cf= 1.058e-10             Clc= 0.0000001              Cle= 0.6
+Dlc= 3E-08                Dwc= 0                      Vfbcv= -1
.tran 5n
.OPTIONS ALLOW_AMBIGUOUS_MODELS
.backanno
.end